# EAGLE design MiniConsoleCarrier (EAGLE 9.6.2)
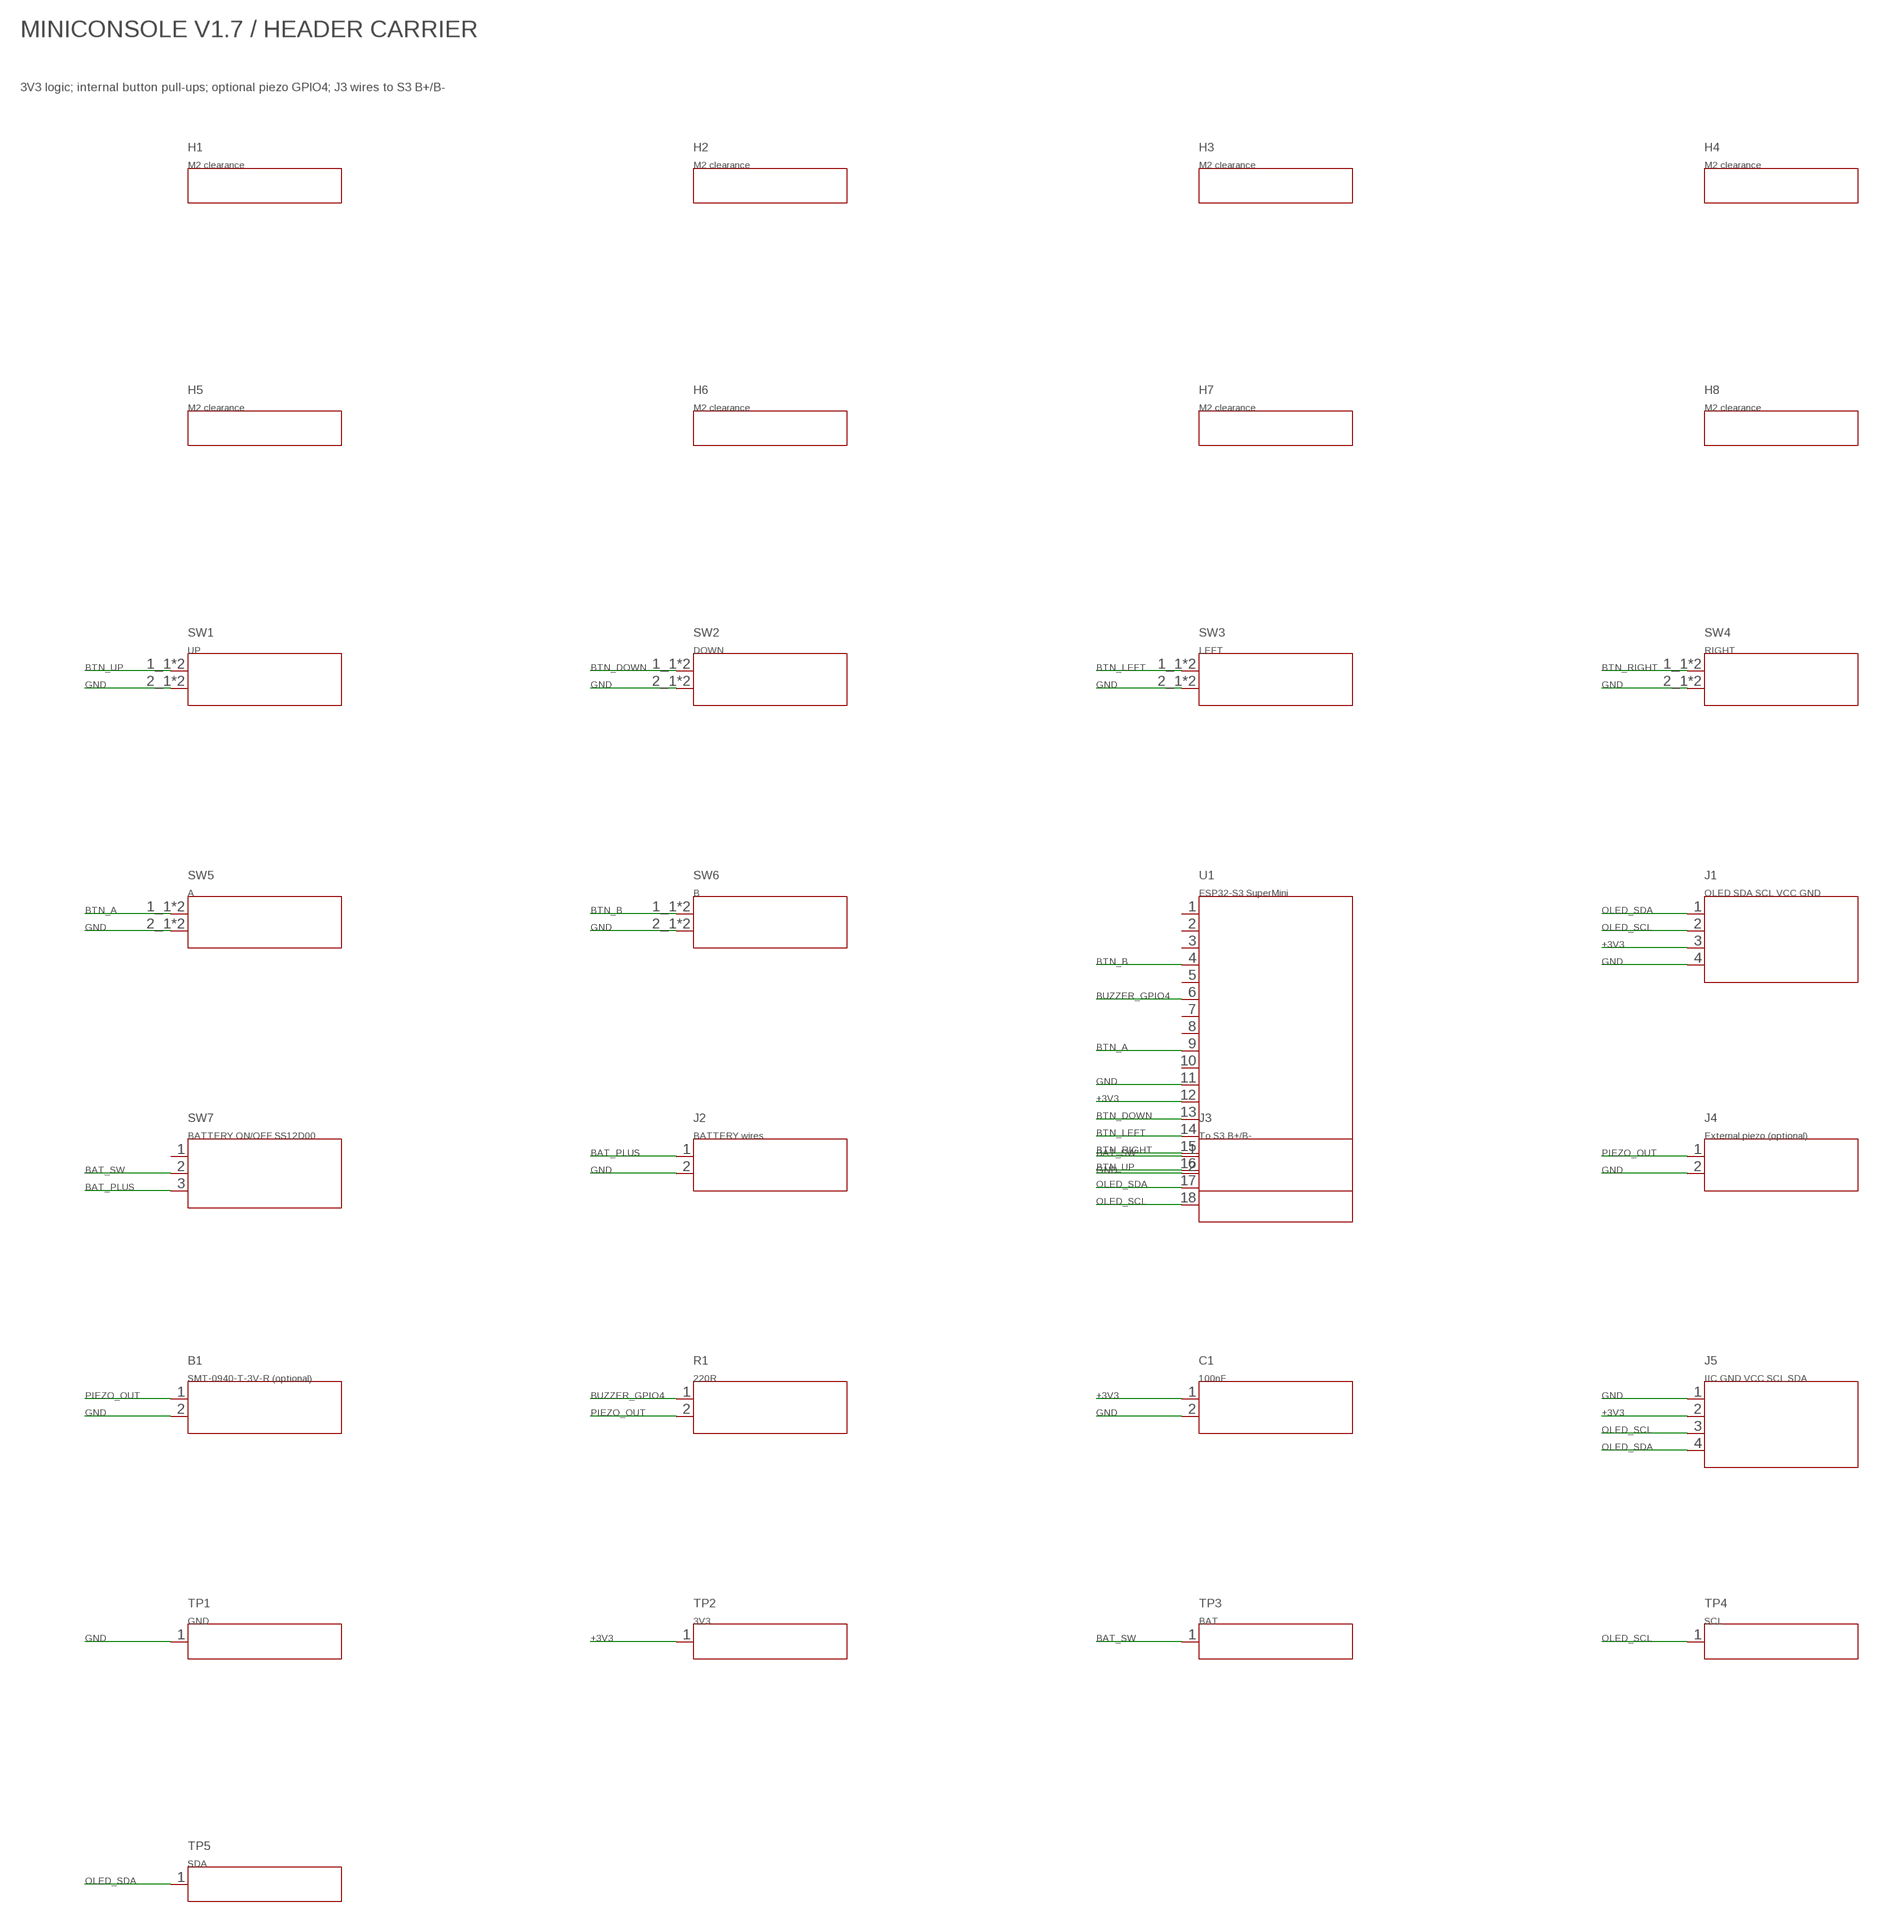
[diagram p0: schematic, sheet 1]

## Parts
B1  SMT-0940-T-3V-R (optional)  Piezo_PUI_SMT0940_180_B1  [Piezo_PUI_SMT0940_180_B1]
C1  100nF  C_0603_180_C1  [C_0603_180_C1]
H1  M2 clearance  Mount_M2_H1  [Mount_M2_H1]
H2  M2 clearance  Mount_M2_H2  [Mount_M2_H2]
H3  M2 clearance  Mount_M2_H3  [Mount_M2_H3]
H4  M2 clearance  Mount_M2_H4  [Mount_M2_H4]
H5  M2 clearance  Mount_M2_H5  [Mount_M2_H5]
H6  M2 clearance  Mount_M2_H6  [Mount_M2_H6]
H7  M2 clearance  Mount_M2_H7  [Mount_M2_H7]
H8  M2 clearance  Mount_M2_H8  [Mount_M2_H8]
J1  OLED SDA SCL VCC GND  OLED_1x04_J1  [OLED_1x04_J1]
J2  BATTERY wires  Wire_2x_2.54_Reverse_J2  [Wire_2x_2.54_Reverse_J2]
J3  To S3 B+/B-  Wire_2x_2.54_J3  [Wire_2x_2.54_J3]
J4  External piezo (optional)  Wire_2x_2.54_Reverse_J4  [Wire_2x_2.54_Reverse_J4]
J5  IIC GND VCC SCL SDA  IIC_1x04_J5  [IIC_1x04_J5]
R1  220R  R_Axial_DIN0207_P7.62_220R_R1  [R_Axial_DIN0207_P7.62_220R_R1]
SW1  UP  SW_6mm_SW1  [SW_6mm_SW1]
SW2  DOWN  SW_6mm_SW2  [SW_6mm_SW2]
SW3  LEFT  SW_6mm_90_SW3  [SW_6mm_90_SW3]
SW4  RIGHT  SW_6mm_90_SW4  [SW_6mm_90_SW4]
SW5  A  SW_6mm_SW5  [SW_6mm_SW5]
SW6  B  SW_6mm_SW6  [SW_6mm_SW6]
SW7  BATTERY ON/OFF SS12D00  SS12D00_LeftEdge_3pin_SW7  [SS12D00_LeftEdge_3pin_SW7]
TP1  GND  TestPoint_D1p5_Rear_TP1  [TestPoint_D1p5_Rear_TP1]
TP2  3V3  TestPoint_D1p5_Rear_TP2  [TestPoint_D1p5_Rear_TP2]
TP3  BAT  TestPoint_D1p5_Rear_TP3  [TestPoint_D1p5_Rear_TP3]
TP4  SCL  TestPoint_D1p5_Rear_TP4  [TestPoint_D1p5_Rear_TP4]
TP5  SDA  TestPoint_D1p5_Rear_TP5  [TestPoint_D1p5_Rear_TP5]
U1  ESP32-S3 SuperMini  S3_Rear_USB_Down_2x09_U1  [S3_Rear_USB_Down_2x09_U1]

## Nets
+3V3: C1.1 J1.3 J5.2 TP2.1 U1.12
BAT_PLUS: J2.1 SW7.3
BAT_SW: J3.1 SW7.2 TP3.1
BTN_A: SW5.1_1(P1) SW5.1_2(P1) U1.9
BTN_B: SW6.1_1(P1) SW6.1_2(P1) U1.4
BTN_DOWN: SW2.1_1(P1) SW2.1_2(P1) U1.13
BTN_LEFT: SW3.1_1(P1) SW3.1_2(P1) U1.14
BTN_RIGHT: SW4.1_1(P1) SW4.1_2(P1) U1.15
BTN_UP: SW1.1_1(P1) SW1.1_2(P1) U1.16
BUZZER_GPIO4: R1.1 U1.6
GND: B1.2 C1.2 J1.4 J2.2 J3.2 J4.2 J5.1 SW1.2_1(P2) SW1.2_2(P2) SW2.2_1(P2) SW2.2_2(P2) SW3.2_1(P2) SW3.2_2(P2) SW4.2_1(P2) SW4.2_2(P2) SW5.2_1(P2) SW5.2_2(P2) SW6.2_1(P2) SW6.2_2(P2) TP1.1 U1.11
OLED_SCL: J1.2 J5.3 TP4.1 U1.18
OLED_SDA: J1.1 J5.4 TP5.1 U1.17
PIEZO_OUT: B1.1 J4.1 R1.2
Unconnected: SW7.1 U1.1 U1.2 U1.3 U1.5 U1.7 U1.8 U1.10

## Notes on the sheet
- MINICONSOLE V1.7 / HEADER CARRIER
- 3V3 logic; internal button pull-ups; optional piezo GPIO4; J3 wires to S3 B+/B-

## Library data of the parts
B1 = MiniConsole:Piezo_PUI_SMT0940_180_B1
C1 = MiniConsole:C_0603_180_C1
H1 = MiniConsole:Mount_M2_H1
H2 = MiniConsole:Mount_M2_H2
H3 = MiniConsole:Mount_M2_H3
H4 = MiniConsole:Mount_M2_H4
H5 = MiniConsole:Mount_M2_H5
H6 = MiniConsole:Mount_M2_H6
H7 = MiniConsole:Mount_M2_H7
H8 = MiniConsole:Mount_M2_H8
J1 = MiniConsole:OLED_1x04_J1
J2 = MiniConsole:Wire_2x_2.54_Reverse_J2
J3 = MiniConsole:Wire_2x_2.54_J3
J4 = MiniConsole:Wire_2x_2.54_Reverse_J4
J5 = MiniConsole:IIC_1x04_J5
R1 = MiniConsole:R_Axial_DIN0207_P7.62_220R_R1
SW1 = MiniConsole:SW_6mm_SW1
SW2 = MiniConsole:SW_6mm_SW2
SW3 = MiniConsole:SW_6mm_90_SW3
SW4 = MiniConsole:SW_6mm_90_SW4
SW5 = MiniConsole:SW_6mm_SW5
SW6 = MiniConsole:SW_6mm_SW6
SW7 = MiniConsole:SS12D00_LeftEdge_3pin_SW7
TP1 = MiniConsole:TestPoint_D1p5_Rear_TP1
TP2 = MiniConsole:TestPoint_D1p5_Rear_TP2
TP3 = MiniConsole:TestPoint_D1p5_Rear_TP3
TP4 = MiniConsole:TestPoint_D1p5_Rear_TP4
TP5 = MiniConsole:TestPoint_D1p5_Rear_TP5
U1 = MiniConsole:S3_Rear_USB_Down_2x09_U1

## Net classes
0 default: width 0.25 mm, drill 0.3 mm

## Board
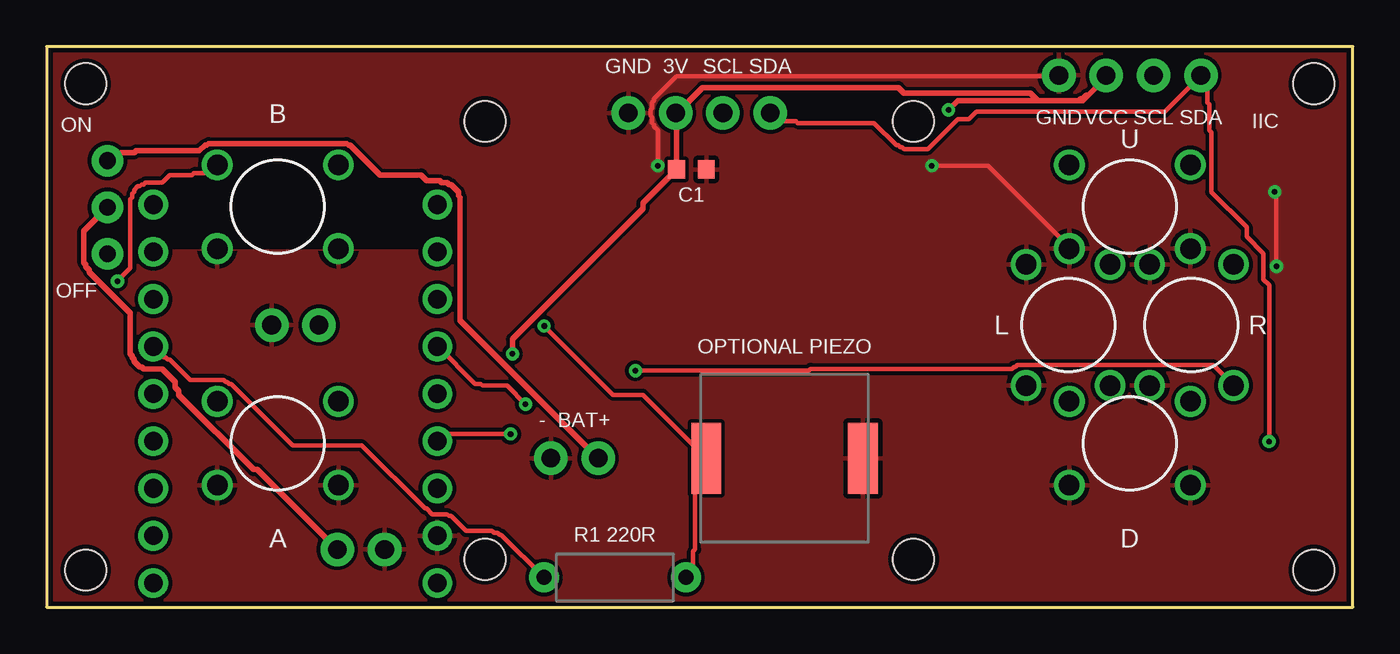
[diagram p1: board, top side]
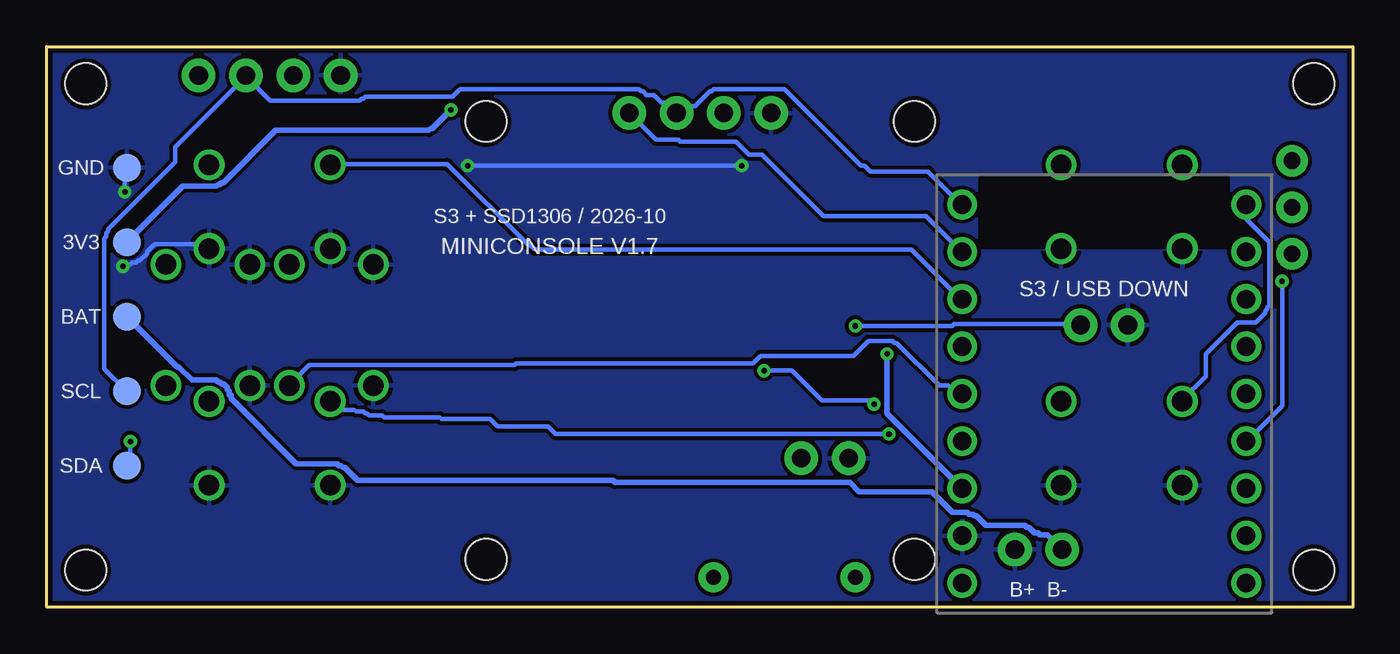
[diagram p2: board, bottom side, seen from below]

Size 70.1 x 30.1 mm. Coordinates in mm from the lower left corner, seen from the top.
Outline: 0,0 70.1,0 70.1,30.1 0,30.1 0,0
Copper layers (1*16): Top 0.035mm / dielectric 1.53mm / Bottom
Design rules "MiniConsole_2layer_0p2mm": minimum track width 0.25mm, minimum drill 0.3mm, track to track 0.2mm, track to pad 0.2mm, pad to pad 0.2mm, via to via 0.2mm, copper to edge 0.25mm, drill to drill 0.25mm, stop-mask expansion 0.05mm, thermal gap 0.25mm
tRestrict: area 6.8,19.4 to 19.9,23
bRestrict: area 6.8,19.4 to 19.9,23
vRestrict: area 6.8,19.4 to 19.9,23

### Footprints (pad centres in the part's own frame; a part is rotated, then mirrored left to right if it is on the bottom)
Piezo_PUI_SMT0940_180_B1 = smd 1.6 x 3.8: 1 -4.2,0; 2 4.2,0
C_0603_180_C1 = smd 0.9 x 1: 1 -0.8,0; 2 0.8,0
Mount_M2_H1 = hole 2.2: 0,0
Mount_M2_H2 = hole 2.2: 0,0
Mount_M2_H3 = hole 2.2: 0,0
Mount_M2_H4 = hole 2.2: 0,0
Mount_M2_H5 = hole 2.2: 0,0
Mount_M2_H6 = hole 2.2: 0,0
Mount_M2_H7 = hole 2.2: 0,0
Mount_M2_H8 = hole 2.2: 0,0
OLED_1x04_J1 = drill 1 pad 1.8 round: 1 0,0; 2 -2.54,0; 3 -5.08,0; 4 -7.62,0
Wire_2x_2.54_Reverse_J2 = drill 1 pad 1.8 round: 1 0,0; 2 -2.54,0
Wire_2x_2.54_J3 = drill 1 pad 1.8 round: 1 0,0; 2 2.54,0
Wire_2x_2.54_Reverse_J4 = drill 1 pad 1.8 round: 1 0,0; 2 -2.54,0
IIC_1x04_J5 = drill 1 pad 1.8 round: 1 0,0; 2 2.54,0; 3 5.08,0; 4 7.62,0
R_Axial_DIN0207_P7.62_220R_R1 = drill 0.8 pad 1.6 round: 1 -3.81,0; 2 3.81,0
SW_6mm_SW1 = drill 1.1 pad 1.45 round: 1_1 -3.25,2.25; 1_2 3.25,2.25; 2_1 -3.25,-2.25; 2_2 3.25,-2.25
SW_6mm_SW2 = drill 1.1 pad 1.45 round: 1_1 -3.25,2.25; 1_2 3.25,2.25; 2_1 -3.25,-2.25; 2_2 3.25,-2.25
SW_6mm_90_SW3 = drill 1.1 pad 1.45 round: 1_1 2.25,3.25; 1_2 2.25,-3.25; 2_1 -2.25,3.25; 2_2 -2.25,-3.25
SW_6mm_90_SW4 = drill 1.1 pad 1.45 round: 1_1 2.25,3.25; 1_2 2.25,-3.25; 2_1 -2.25,3.25; 2_2 -2.25,-3.25
SW_6mm_SW5 = drill 1.1 pad 1.45 round: 1_1 -3.25,2.25; 1_2 3.25,2.25; 2_1 -3.25,-2.25; 2_2 3.25,-2.25
SW_6mm_SW6 = drill 1.1 pad 1.45 round: 1_1 -3.25,2.25; 1_2 3.25,2.25; 2_1 -3.25,-2.25; 2_2 3.25,-2.25
SS12D00_LeftEdge_3pin_SW7 = drill 0.9 pad 1.7 round: 1 0,-2.5; 2 0,0; 3 0,2.5
TestPoint_D1p5_Rear_TP1 = smd 1.5 x 1.5: 1 0,0
TestPoint_D1p5_Rear_TP2 = smd 1.5 x 1.5: 1 0,0
TestPoint_D1p5_Rear_TP3 = smd 1.5 x 1.5: 1 0,0
TestPoint_D1p5_Rear_TP4 = smd 1.5 x 1.5: 1 0,0
TestPoint_D1p5_Rear_TP5 = smd 1.5 x 1.5: 1 0,0
S3_Rear_USB_Down_2x09_U1 = drill 1 pad 1.6 round: 1 7.62,-10.16; 2 7.62,-7.62; 3 7.62,-5.08; 4 7.62,-2.54; 5 7.62,0; 6 7.62,2.54; 7 7.62,5.08; 8 7.62,7.62; 9 7.62,10.16; 10 -7.62,-10.16; 11 -7.62,-7.62; 12 -7.62,-5.08; 13 -7.62,-2.54; 14 -7.62,0; 15 -7.62,2.54; 16 -7.62,5.08; 17 -7.62,7.62; 18 -7.62,10.16

### Placement (x,y rotation side)
B1  39.6,8 0 top
C1  34.6,23.5 0 top
H1  68,2 0 top
H2  2.1,2 0 top
H3  68,28.1 0 top
H4  2.1,28.1 0 top
H5  46.52,2.58 0 top
H6  23.52,2.58 0 top
H7  46.52,26.08 0 top
H8  23.52,26.08 0 top
J1  38.84,26.53 0 top
J2  29.6,8 0 top
J3  15.6,3.1 0 top
J4  14.62,15.15 0 top
J5  54.32,28.55 0 top
R1  30.5,1.6 0 top
SW1  58.13,21.5 0 top
SW2  58.13,8.8 0 top
SW3  54.82,15.15 0 top
SW4  61.44,15.15 0 top
SW5  12.41,8.8 0 top
SW6  12.41,21.5 0 top
SW7  3.27,21.47 0 top
TP1  65.8,23.6 0 bottom
TP2  65.8,19.6 0 bottom
TP3  65.8,15.6 0 bottom
TP4  65.8,11.6 0 bottom
TP5  65.8,7.6 0 bottom
U1  13.35,11.46 0 bottom

### Tracks (layer width: path | path; a pad name or v marks a point on that pad's centre or on a via)
+3V3  (via drill 0.3 pad 0.6)
  Top 0.3: 56.9,28.5 55.9,27.5 55.8,27.5 55.6,27.3 55.5,27.3 55.4,27.2 48.9,27.2 v48.4,26.7 | 33.8,26.5 J1.3 33.8,26.5 | 56.9,28.5 J5.2 56.9,28.5 | v25,13.6 25,14.4 32,21.4 32,21.7 C1.1 33.8,26.5 | 56.9,28.5 55.6,27.2 53.2,27.2 52.8,27.6 46,27.6 45.7,27.9 35.2,27.9 33.8,26.5
  Bottom 0.3: U1.12 21,6.4 25,10.4 v25,13.6 | v48.4,26.7 49.4,25.7 49.5,25.7 49.6,25.6 57.8,25.6 60.6,22.8 60.7,22.8 60.8,22.7 60.9,22.7 61,22.6 62.8,22.6 TP2.1
BAT_PLUS
  Top 0.3: J2.1 22.2,15.4 22.2,22 22.1,22.1 22.1,22.3 21.7,22.7 21.6,22.7 21.5,22.8 21.2,22.8 21.1,22.9 20.4,22.9 20.1,23.2 17.9,23.2 16.3,24.8 16.2,24.8 16.1,24.9 8.7,24.9 8.6,24.8 8.5,24.8 8.2,24.5 4.8,24.5 4.7,24.4 4,24.4 3.9,24.3 3.7,24.3 3.6,24.2 3.5,24.2 3.3,24 SW7.3
BAT_SW
  Top 0.3: J3.1 11.3,7.4 11.1,7.4 7.1,11.4 7.1,11.6 6.9,11.8 6.9,12.1 6.2,12.8 5.2,12.8 5.1,12.9 5,12.9 4.7,13.2 4.7,13.3 4.6,13.4 4.6,13.5 4.5,13.6 4.5,15.8 2.3,18 2.3,18.1 2.1,18.3 2.1,18.4 2,18.5 2,20.2 3.3,21.5 SW7.2
  Bottom 0.3: J3.1 16.4,3.9 16.8,3.9 16.9,4 17.1,4 17.4,4.3 17.5,4.3 17.6,4.4 19.7,4.4 20.2,4.9 20.3,4.9 20.4,5 20.6,5 20.7,5.1 21.5,5.1 22.6,6.2 26.5,6.2 27,6.7 39.6,6.7 39.7,6.8 53.4,6.8 54.1,7.5 54.2,7.5 54.3,7.6 54.4,7.6 54.5,7.7 56.7,7.7 60.2,11.2 60.2,11.4 60.3,11.4 60.3,11.6 60.4,11.7 60.4,11.8 60.6,12 60.7,12 60.8,12.1 60.9,12.1 61,12.2 62.3,12.2 63,12.9 63.1,12.9 TP3.1
BTN_A
  Bottom 0.25: U1.9 5.7,21.6 5.7,20.8 4.5,19.6 4.5,16.2 4.6,16.1 4.6,16 4.7,15.9 4.7,15.8 5.2,15.3 6.2,15.3 7.9,13.6 7.9,12.4 9.2,11.1 SW5.1_1
BTN_B  (via drill 0.3 pad 0.6)
  Top 0.25: SW6.1_1 9.2,23.8 8.8,23.4 8.7,23.4 8.6,23.3 7.9,23.3 7.8,23.2 6.6,23.2 6.2,22.8 5.3,22.8 5.2,22.7 5.1,22.7 5,22.6 4.9,22.6 4.7,22.4 4.7,22.3 4.6,22.2 4.6,22 4.5,21.9 4.5,18.2 v3.8,17.5
  Bottom 0.25: U1.4 5.7,8.9 3.8,10.8 v3.8,17.5
BTN_DOWN  (via drill 0.3 pad 0.6)
  Top 0.25: U1.13 21,8.9 21.4,9.3 v24.9,9.3
  Bottom 0.25: v24.9,9.3 42.8,9.3 43.2,9.7 45.9,9.7 46.3,10.1 48.9,10.1 49,10.2 52,10.2 52.1,10.3 52.8,10.3 52.9,10.4 53,10.4 53.1,10.5 53.5,10.5 53.6,10.6 54.2,10.6 54.3,10.7 54.5,10.7 54.9,11.1 SW2.1_1
BTN_LEFT
  Bottom 0.25: SW3.1_2 57.1,11.9 56,13 45,13 44.9,13.1 32.2,13.1 31.8,13.5 26.8,13.5 26,14.3 24.7,14.3 24.6,14.2 24.5,14.2 22.2,11.9 21.7,11.9 21.6,11.8 21.4,11.8 21.3,11.7 21.2,11.7 21,11.5 U1.14
BTN_RIGHT  (via drill 0.3 pad 0.6)
  Top 0.25: v25.7,10.9 24.7,11.9 23.4,11.9 23.3,12 23,12 21,14 U1.15 | v31.6,12.7 40.9,12.7 41,12.8 51.8,12.8 51.9,12.9 52,12.9 52.1,13 62.6,13 SW4.1_2
  Bottom 0.25: v31.6,12.7 30.1,12.7 28.5,11.1 25.9,11.1 v25.7,10.9
BTN_UP
  Bottom 0.25: U1.16 21,16.5 23.7,19.2 43.9,19.2 44.2,19.5 44.3,19.5 48.6,23.8 54.9,23.8 SW1.1_1
BUZZER_GPIO4
  Top 0.25: R1.1 24.4,3.9 24.3,3.9 24.2,4 24,4 23.9,4.1 22.5,4.1 21.7,4.9 21.6,4.9 21.5,5 20.7,5 20.4,5.3 20.3,5.3 16.9,8.7 13.2,8.7 9.9,12 9.8,12 9.7,12.1 9.6,12.1 9.5,12.2 7.7,12.2 6.6,13.3 6.5,13.3 6.4,13.4 6.3,13.4 5.7,14 U1.6
GND  (via drill 0.3 pad 0.6)
  Top 0.25: v66,18.3 66,22.2 v65.9,22.3 | J5.1 54.3,28.5 33.8,28.5 32.6,27.3 32.6,27.2 32.5,27.1 32.5,26.8 32.4,26.7 32.4,26.4 32.5,26.3 32.5,26 32.6,25.9 32.6,25.8 32.8,25.6 v32.8,23.7 | v47.5,23.7 50.5,23.7 54.9,19.3 SW1.2_1
  Bottom 0.25: SW1.2_2 61.4,19.3 61.6,19.5 64.3,19.5 64.7,19.1 64.7,19 65.1,18.6 65.2,18.6 65.3,18.5 65.5,18.5 65.6,18.4 65.9,18.4 v66,18.3 | TP1.1 65.9,23.5 v65.9,22.3 | v32.8,23.7 v47.5,23.7
  pour Top (isolate 0.2): 0.3,0.3 69.8,0.3 69.8,29.8 0.3,29.8
  pour Bottom (isolate 0.2): 0.3,0.3 69.8,0.3 69.8,29.8 0.3,29.8
OLED_SCL
  Bottom 0.25: U1.18 21,21.6 22.8,23.4 25.9,23.4 26.2,23.7 26.4,23.7 30.5,27.8 34.3,27.8 34.4,27.7 34.5,27.7 35.3,26.9 35.6,26.9 35.7,26.8 35.9,26.8 36,26.7 36.1,26.7 36.3,26.5 | 36.3,26.5 J1.2 36.3,26.5 | 59.4,28.5 J5.3 59.4,28.5 | TP4.1 67,12.8 67,19.8 66.9,19.9 66.9,20.1 66.8,20.2 66.8,20.3 63.2,23.9 63.2,24.7 59.4,28.5 | 59.4,28.5 58.1,27.2 53.3,27.2 53.2,27.3 53.1,27.3 53,27.4 48.3,27.4 47.9,27.8 38.3,27.8 38.2,27.7 38.1,27.7 37.9,27.5 37.5,27.5 37.1,27.1 36.9,27.1 36.3,26.5
OLED_SDA  (via drill 0.3 pad 0.6)
  Top 0.25: 61.9,28.5 J5.4 61.9,28.5 | 61.9,28.5 60,26.6 49.9,26.6 49.5,26.2 48.9,26.2 47.3,24.6 46,24.6 45.9,24.7 45.8,24.7 45.7,24.8 45.6,24.8 44.4,26 40.3,26 40.2,26.1 39.5,26.1 39.4,26.2 39.2,26.2 39.1,26.3 39,26.3 38.8,26.5 J1.1 | 61.9,28.5 62.1,28.3 62.1,28.2 62.2,28.1 62.2,27.9 62.3,27.8 62.3,27.1 62.4,27 62.4,25.6 62.5,25.5 62.5,22.3 64.4,20.4 64.4,19.9 65.3,19 65.3,17.6 65.6,17.3 v65.6,8.9
  Bottom 0.25: U1.17 21,19.1 22.9,21 28.4,21 31.7,24.3 32.4,24.3 33.1,25 36.1,25 36.2,25.1 37.4,25.1 38.8,26.5 J1.1 | TP5.1 65.6,7.8 v65.6,8.9
PIEZO_OUT  (via drill 0.3 pad 0.6)
  Top 0.25: R1.2 34.5,1.8 34.5,1.9 34.6,2 34.6,2.2 34.7,2.3 34.7,3 34.8,3.1 34.8,7.4 B1.1 32,11.4 30.4,11.4 v26.7,15.1
  Bottom 0.25: v26.7,15.1 21.5,15.1 21.4,15.2 14.6,15.2 J4.1

### Text on the board
tPlace: GND | 3V | SCL | SDA | ON | B | GND | VCC | SCL | SDA | IIC | U | C1 | OFF | L | R | OPTIONAL PIEZO | - BAT+ | A | R1 220R | D
bPlace: GND | S3 + SSD1306 / 2026-10 | 3V3 | MINICONSOLE V1.7 | S3 / USB DOWN | BAT | SCL | SDA | B+ B-